# Altium schematic sheet OFS.SchDoc
size A4; SheetNumber: 3; SheetTotal: 7
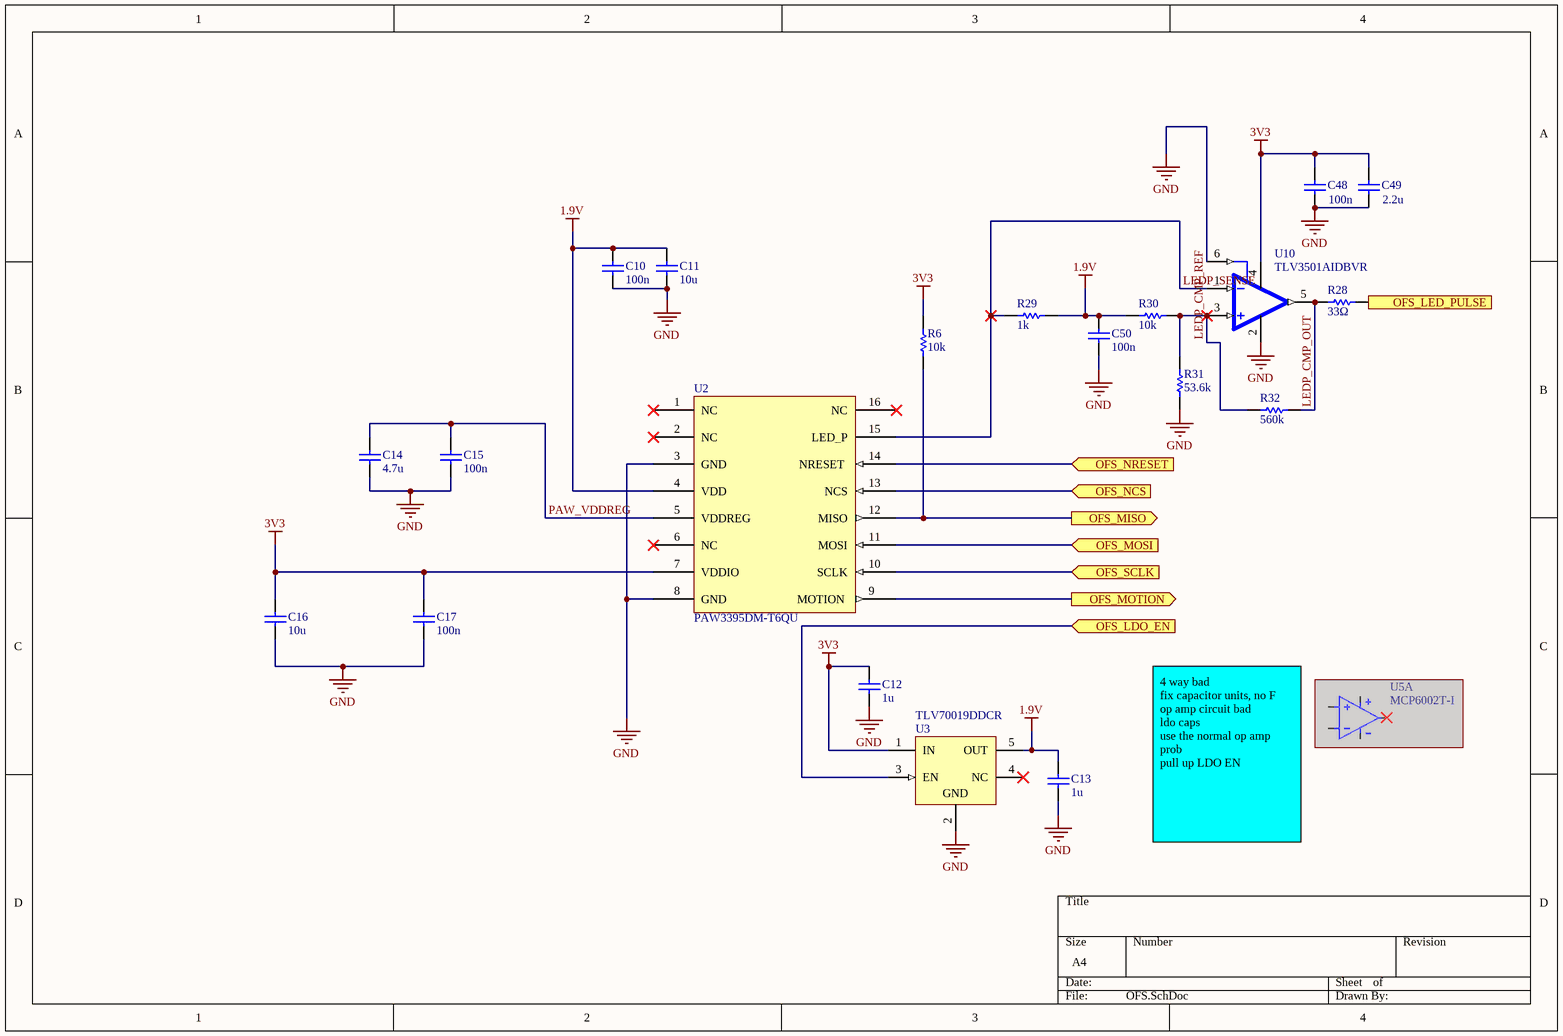
[diagram p0: OFS.SchDoc]

## Parts
C10  value 100n  [0603_CAP]  (hidden comment: Capacitor)
C11  value 10u  [0603_CAP]  (hidden comment: Capacitor)
C12  value 1u  [0603_CAP]  (hidden comment: Capacitor)
C13  value 1u  [0603_CAP]  (hidden comment: Capacitor)
C14  value 4.7u  [0603_CAP]  (hidden comment: Capacitor)
C15  value 100n  [0603_CAP]  (hidden comment: Capacitor)
C16  value 10u  [0603_CAP]  (hidden comment: Capacitor)
C17  value 100n  [0603_CAP]  (hidden comment: Capacitor)
C48  value 100n  [0603_CAP]  (hidden comment: Capacitor)
C49  value 2.2u  [0603_CAP]  (hidden comment: Capacitor)
C50  value 100n  [0603_CAP]  (hidden comment: Capacitor)
R6  value 10k  [0603_RES]  (hidden comment: Resistor)
R28  value 33Ω  [0603_RES]  (hidden comment: Resistor)
R29  value 1k  [0603_RES]  (hidden comment: Resistor)
R30  value 10k  [0603_RES]  (hidden comment: Resistor)
R31  value 53.6k  [0603_RES]  (hidden comment: Resistor)
R32  value 560k  [0603_RES]  (hidden comment: Resistor)
U2  PAW3395DM-T6QU  [PAW3395DM-T6QU]
U3  TLV70019DDCR  [DDC0005A_L]
U5  MCP6002T-I  [SOIC-8]  (part A of 2)  (masked out: inside a compile mask, not in the netlist)
U10  TLV3501AIDBVR  [SOT95P280X145-6N]

## Ports
OFS_LDO_EN (in, see TOP-LEVEL[4B], MCU[1C]), OFS_LED_PULSE (out, see TOP-LEVEL[4B], MCU[1B]), OFS_MISO (out, see TOP-LEVEL[4B], MCU[2C]), OFS_MOSI (in, see TOP-LEVEL[4B], MCU[2C]), OFS_MOTION (out, see TOP-LEVEL[4B], MCU[1C]), OFS_NCS (in, see TOP-LEVEL[4B], MCU[2C]), OFS_NRESET (in, see TOP-LEVEL[4B], MCU[1C]), OFS_SCLK (in, see TOP-LEVEL[4B], MCU[2C])

## Nets
1.9V: C10.2 C11.2 C13.2 C50.2 R29.1 R30.2 U2.4(VDD) U3.5(OUT)
3V3: C12.2 C16.2 C17.2 C48.2 C49.2 R6.2 U2.7(VDDIO) U3.1(IN) U10.4(V+)
GND: C10.1 C11.1 C12.1 C13.1 C14.1 C15.1 C16.1 C17.1 C48.1 C49.1 C50.1 R31.2 U2.3(GND) U2.8(GND) U3.2(GND) U10.2(V-) U10.6(SHDN)
LEDP_CMP_OUT: R28.2 R32.1 U10.5(OUT)
LEDP_CMP_REF: R30.1 R31.1 R32.2 U10.3(+IN)
LEDP_SENSE: R29.2 U2.15(LED_P) U10.1(-IN)
OFS_LDO_EN: U3.3(EN) ; port OFS_LDO_EN
OFS_LED_PULSE: R28.1 ; port OFS_LED_PULSE
OFS_MISO: R6.1 U2.12(MISO) ; port OFS_MISO
OFS_MOSI: U2.11(MOSI) ; port OFS_MOSI
OFS_MOTION: U2.9(MOTION) ; port OFS_MOTION
OFS_NCS: U2.13(NCS) ; port OFS_NCS
OFS_NRESET: U2.14(NRESET) ; port OFS_NRESET
OFS_SCLK: U2.10(SCLK) ; port OFS_SCLK
PAW_VDDREG: C14.2 C15.2 U2.5(VDDREG)

Not connected (* = marked no-connect by the designer): U2 1(NC)* 2(NC)* 6(NC)* 16(NC)*; U3 4(NC)*

## Notes on the sheet
- (near U5) 4 way bad
  fix capacitor units, no F
  op amp circuit bad
  ldo caps
  use the normal op amp prob
  pull up LDO EN

## Library data of the parts
C10-C17 C48-C50 = Capacitor: SimulationGenericComponent: True
R6 R28-R32 = Resistor: TC1: 0; SimulationGenericComponent: True; TC2: 0
U2 = PAW3395DM-T6QU: PixArt PAW3395DM-T6QU optical navigation sensor, 16-pin molded lead-frame DIP, 1.78mm pitch staggered dual row, 10.7mm row spacing, through-hole
U3 = CMP-0394-01054-2: Single Output LDO, 200 mA, Fixed 1.9 V Output, 2 to 5.5 V Input, with Low IQ, 5-pin SOT (DDC), -40 to 125 degC, Green (RoHS & no Sb/Br); Manufacturer: Texas Instruments; Iq(Typ)(mA): 0.03; Vin(Max)(V): 5.5; Accuracy(%): 2; Vout Adj(Min)(V): 1.9; Iout(Max)(A): 0.2; SubFamily: Single Channel LDO; Vdo(Typ)(mV): 175; ComponentLink2Description: Datasheet; PackageReference: DDC0005A; DatasheetVersion: SLVSA00D; ComponentLink3Description: Package Specification; ComponentLink2URL: http://www.ti.com/general/docs/lit/getliterature.tsp?genericPartNumber=TLV70019&fileType=pdf; PartNumber: TLV70019DDCR; PackageVersion: 4204403-2/E; Code_JEDEC: MO-193; ComponentLink1URL: http://www.ti.com/; Eco-Plan: Green (RoHS & no Sb/Br); PackageDescription: 5-Pin Plastic Small Outline, Body 2.9 x 1.6 mm, 0.95 mm Pitch; Fixed Output Options(V): 1.9; Vout Adj(Max)(V): 1.9; Vin(Min)(V): 2; Mounting Technology: Surface Mount; ComponentLink1Description: Manufacturer URL; ComponentLink3URL: http://www.ti.com/litv/pdf/mpds123d
U5 = MCP6002T-I: Num_Circuits: 2; Voltage: 6; Link: https://www.digikey.com/product-detail/en/microchip-technology/MCP6002T-I-SN/MCP6002T-I-SNCT-ND/4307905
U10 = TLV3501AIDBVR: 4.5ns, Rail-to-Rail, High Speed Comparator with Shutdown; MF: Texas Instruments; SnapEDA_Link: https://www.snapeda.com/parts/TLV3501AIDBVR/Texas+Instruments/view-part/?ref=snap; Package: SOT-23-6 Texas Instruments; Value: *; MP: TLV3501AIDBVR; Check_prices: https://www.snapeda.com/parts/TLV3501AIDBVR/Texas+Instruments/view-part/?ref=eda